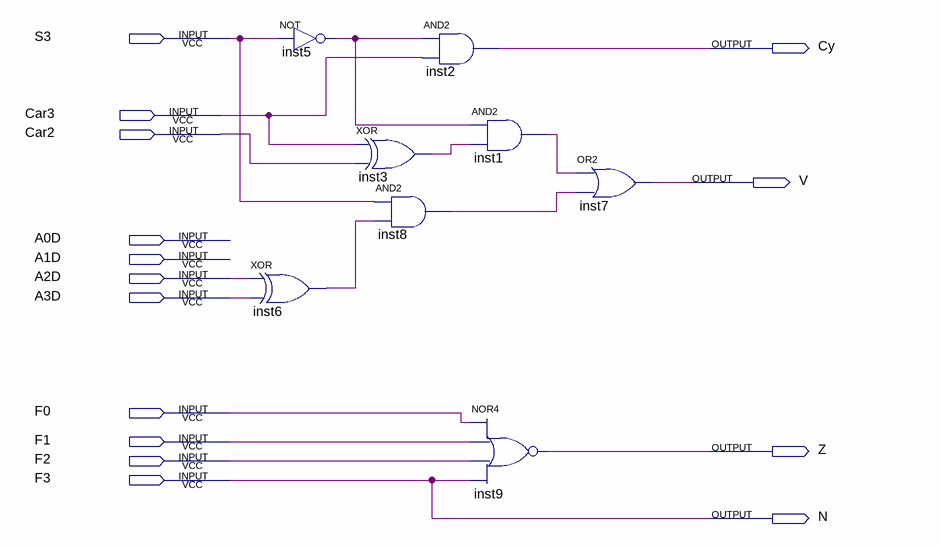
[diagram p0: schematic sheet]
// Quartus schematic state4bit.bdf as structural Verilog: 8 symbols, 15 pins
module state4bit (
  input  S3,
  input  Car3,
  input  Car2,
  input  A0D,
  input  A1D,
  input  A2D,
  input  A3D,
  input  F0,
  input  F1,
  input  F2,
  input  F3,
  output Cy,
  output V,
  output Z,
  output N
);

  wire inst1_out, inst3_out, inst5_out, inst6_out, inst8_out;

  xor inst6 (inst6_out, A2D, A3D);
  not inst5 (inst5_out, S3);
  and inst2 (Cy, inst5_out, Car3);
  xor inst3 (inst3_out, Car3, Car2);
  and inst8 (inst8_out, S3, inst6_out);
  and inst1 (inst1_out, inst5_out, inst3_out);
  nor inst9 (Z, F0, F1, F2, F3);
  or inst7 (V, inst1_out, inst8_out);

  assign N = F3;
endmodule
